# Altium schematic sheet SCD2326控制板-V0.3.SchDoc
size A1; SheetNumber: 1; SheetTotal: 1
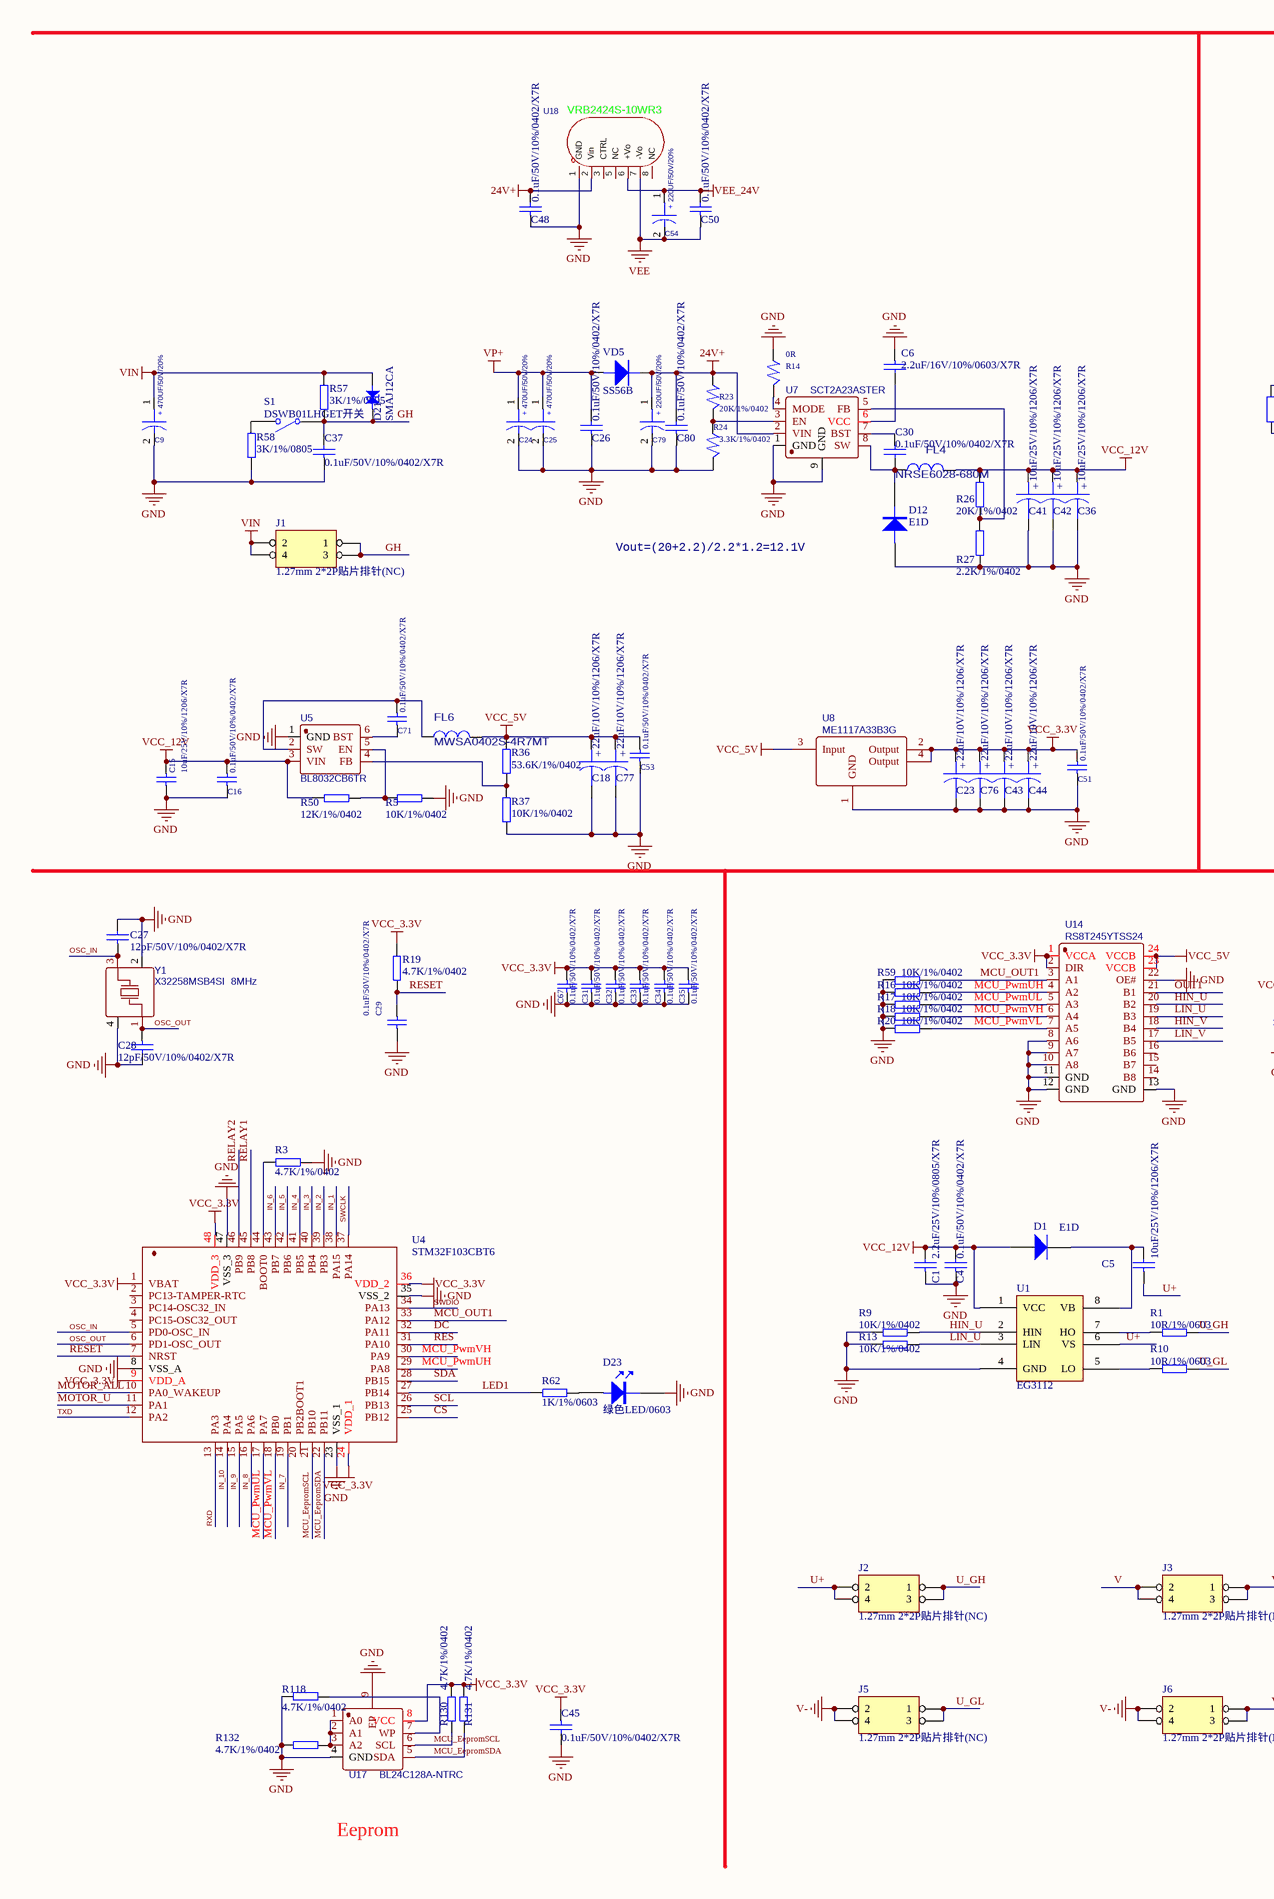
[diagram p0: SCD2326控制板-V0.3.SchDoc, left]
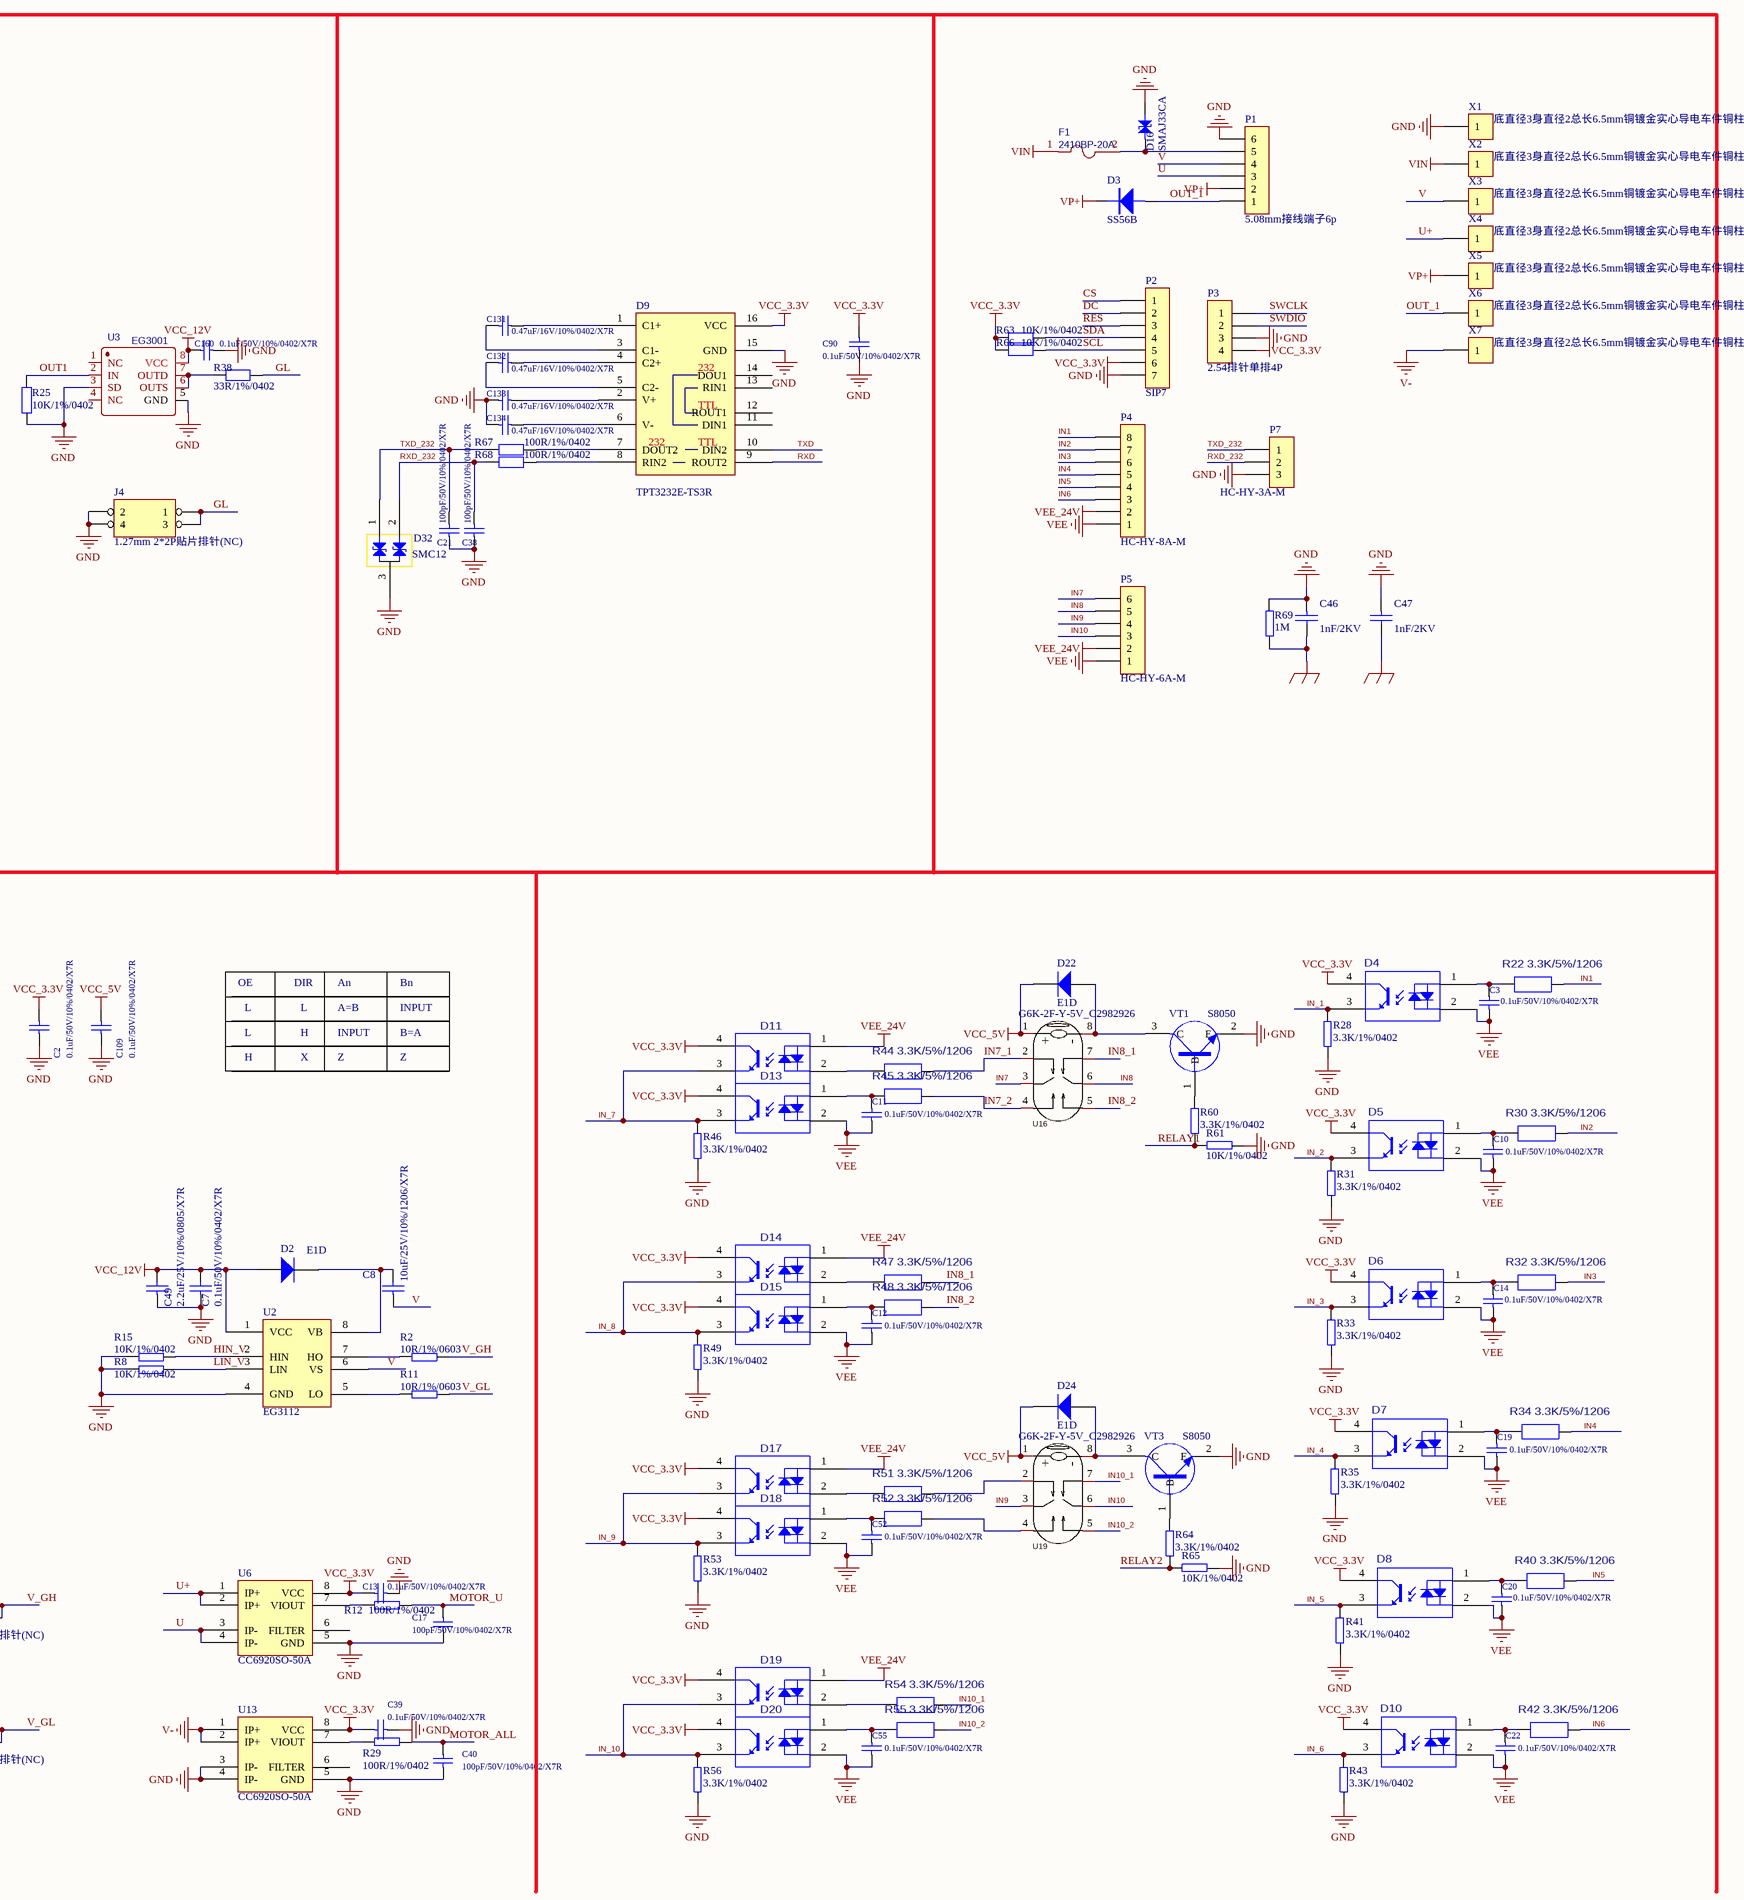
[diagram p1: SCD2326控制板-V0.3.SchDoc, right]

## Parts
C1  2.2uF/25V/10%/0805/X7R  [SC0805]
C2  0.1uF/50V/10%/0402/X7R  [SC0402]
C3  0.1uF/50V/10%/0402/X7R  [SC0402]
C4  0.1uF/50V/10%/0402/X7R  [SC0402]
C5  10uF/25V/10%/1206/X7R  [SC1206]
C6  2.2uF/16V/10%/0603/X7R  [SC0603]
C7  0.1uF/50V/10%/0402/X7R  [SC0402]
C8  10uF/25V/10%/1206/X7R  [SC1206]
C9  470UF/50V/20%  [D10]
C10  0.1uF/50V/10%/0402/X7R  [SC0402]
C11  0.1uF/50V/10%/0402/X7R  [SC0402]
C12  0.1uF/50V/10%/0402/X7R  [SC0402]
C13  0.1uF/50V/10%/0402/X7R  [SC0402]
C14  0.1uF/50V/10%/0402/X7R  [SC0402]
C15  10uF/25V/10%/1206/X7R  [SC1206]
C16  0.1uF/50V/10%/0402/X7R  [SC0402]
C17  100pF/50V/10%/0402/X7R  [SC0402]
C18  22uF/10V/10%/1206/X7R  [SC1206]
C19  0.1uF/50V/10%/0402/X7R  [SC0402]
C20  0.1uF/50V/10%/0402/X7R  [SC0402]
C21  100pF/50V/10%/0402/X7R  [SC0402]
C22  0.1uF/50V/10%/0402/X7R  [SC0402]
C23  22uF/10V/10%/1206/X7R  [SC1206]
C24  470UF/50V/20%  [D10]
C25  470UF/50V/20%  [D10]
C26  0.1uF/50V/10%/0402/X7R  [SC0402]
C27  12pF/50V/10%/0402/X7R  [SC0402]
C28  12pF/50V/10%/0402/X7R  [SC0402]
C29  0.1uF/50V/10%/0402/X7R  [SC0402]
C30  0.1uF/50V/10%/0402/X7R  [SC0402]
C31  0.1uF/50V/10%/0402/X7R  [SC0402]
C32  0.1uF/50V/10%/0402/X7R  [SC0402]
C33  0.1uF/50V/10%/0402/X7R  [SC0402]
C34  0.1uF/50V/10%/0402/X7R  [SC0402]
C35  0.1uF/50V/10%/0402/X7R  [SC0402]
C36  10uF/25V/10%/1206/X7R  [SC1206]
C37  0.1uF/50V/10%/0402/X7R  [SC0402]
C38  100pF/50V/10%/0402/X7R  [SC0402]
C39  0.1uF/50V/10%/0402/X7R  [SC0402]
C40  100pF/50V/10%/0402/X7R  [SC0402]
C41  10uF/25V/10%/1206/X7R  [SC1206]
C42  10uF/25V/10%/1206/X7R  [SC1206]
C43  22uF/10V/10%/1206/X7R  [SC1206]
C44  22uF/10V/10%/1206/X7R  [SC1206]
C45  0.1uF/50V/10%/0402/X7R  [SC0402]
C46  value 1nF/2KV  [1206_C]  (hidden comment: 1nF/2KV/10% X7R)
C47  value 1nF/2KV  [1206_C]  (hidden comment: 1nF/2KV/10% X7R)
C48  0.1uF/50V/10%/0402/X7R  [SC0402]
C49  2.2uF/25V/10%/0805/X7R  [SC0805]
C50  0.1uF/50V/10%/0402/X7R  [SC0402]
C51  0.1uF/50V/10%/0402/X7R  [SC0402]
C52  0.1uF/50V/10%/0402/X7R  [SC0402]
C53  0.1uF/50V/10%/0402/X7R  [SC0402]
C54  220UF/50V/20%  [D8]
C55  0.1uF/50V/10%/0402/X7R  [SC0402]
C67  0.1uF/50V/10%/0402/X7R  [SC0402]
C71  0.1uF/50V/10%/0402/X7R  [SC0402]
C76  22uF/10V/10%/1206/X7R  [SC1206]
C77  22uF/10V/10%/1206/X7R  [SC1206]
C79  220UF/50V/20%  [D8]
C80  0.1uF/50V/10%/0402/X7R  [SC0402]
C90  0.1uF/50V/10%/0402/X7R  [SC0402]
C109  0.1uF/50V/10%/0402/X7R  [SC0402]
C131  0.47uF/16V/10%/0402/X7R  [SC0402]
C132  0.47uF/16V/10%/0402/X7R  [SC0402]
C133  0.47uF/16V/10%/0402/X7R  [SC0402]
C134  0.47uF/16V/10%/0402/X7R  [SC0402]
C160  0.1uF/50V/10%/0402/X7R  [SC0402]
D1  E1D  [SOD123]
D2  E1D  [SOD123]
D3  SS56B  [DO-214AA]
D4  EL3H4(A)(TA)-G  [SOP-4]  (value not drawn)
D5  EL3H4(A)(TA)-G  [SOP-4]  (value not drawn)
D6  EL3H4(A)(TA)-G  [SOP-4]  (value not drawn)
D7  EL3H4(A)(TA)-G  [SOP-4]  (value not drawn)
D8  EL3H4(A)(TA)-G  [SOP-4]  (value not drawn)
D9  TPT3232E-TS3R  [TSSOP16]
D10  EL3H4(A)(TA)-G  [SOP-4]  (value not drawn)
D11  EL3H4(A)(TA)-G  [SOP-4]  (value not drawn)
D12  E1D  [SOD123]
D13  EL3H4(A)(TA)-G  [SOP-4]  (value not drawn)
D14  EL3H4(A)(TA)-G  [SOP-4]  (value not drawn)
D15  EL3H4(A)(TA)-G  [SOP-4]  (value not drawn)
D16  SMAJ33CA  [DO-214AC]
D17  EL3H4(A)(TA)-G  [SOP-4]  (value not drawn)
D18  EL3H4(A)(TA)-G  [SOP-4]  (value not drawn)
D19  EL3H4(A)(TA)-G  [SOP-4]  (value not drawn)
D20  EL3H4(A)(TA)-G  [SOP-4]  (value not drawn)
D21  SMAJ12CA  [DO-214AC]
D22  E1D  [SOD123]
D23  绿色LED/0603  [LED0603]
D24  E1D  [SOD123]
D32  SMC12  [SOT-23]
F1  2410BP-20A  [SMD2410]
FL4  NRSE6028-680M  [SMD6*6]
FL6  MWSA0402S-4R7MT  [SMD4*4]
J1  1.27mm 2*2P贴片排针(NC)  [CON_1D27_2X2]
J2  1.27mm 2*2P贴片排针(NC)  [CON_1D27_2X2]
J3  1.27mm 2*2P贴片排针(NC)  [CON_1D27_2X2]
J4  1.27mm 2*2P贴片排针(NC)  [CON_1D27_2X2]
J5  1.27mm 2*2P贴片排针(NC)  [CON_1D27_2X2]
J6  1.27mm 2*2P贴片排针(NC)  [CON_1D27_2X2]
P1  5.08mm接线端子6p  [CON_5.08_6P]
P2  SIP7  [SIP7]
P3  2.54排针单排4P  [SIP4]
P4  HC-HY-8A-M  [HC-HY-8A-M]
P5  HC-HY-6A-M  [HC-HY-6A-M]
P7  HC-HY-3A-M  [HC-HY-3A-M]
R1  10R/1%/0603  [SR0603]
R2  10R/1%/0603  [SR0603]
R3  4.7K/1%/0402  [SR0402]
R5  10K/1%/0402  [SR0402]
R8  10K/1%/0402  [SR0402]
R9  10K/1%/0402  [SR0402]
R10  10R/1%/0603  [SR0603]
R11  10R/1%/0603  [SR0603]
R12  100R/1%/0402  [SR0402]
R13  10K/1%/0402  [SR0402]
R14  0R  [SR0402]
R15  10K/1%/0402  [SR0402]
R16  10K/1%/0402  [SR0402]
R17  10K/1%/0402  [SR0402]
R18  10K/1%/0402  [SR0402]
R19  4.7K/1%/0402  [SR0402]
R20  10K/1%/0402  [SR0402]
R22  3.3K/5%/1206  [SR1206]
R23  20K/1%/0402  [SR0402]
R24  3.3K/1%/0402  [SR0402]
R25  10K/1%/0402  [SR0402]
R26  20K/1%/0402  [SR0402]
R27  2.2K/1%/0402  [SR0402]
R28  3.3K/1%/0402  [SR0402]
R29  100R/1%/0402  [SR0402]
R30  3.3K/5%/1206  [SR1206]
R31  3.3K/1%/0402  [SR0402]
R32  3.3K/5%/1206  [SR1206]
R33  3.3K/1%/0402  [SR0402]
R34  3.3K/5%/1206  [SR1206]
R35  3.3K/1%/0402  [SR0402]
R36  53.6K/1%/0402  [SR0402]
R37  10K/1%/0402  [SR0402]
R38  33R/1%/0402  [SR0402]
R40  3.3K/5%/1206  [SR1206]
R41  3.3K/1%/0402  [SR0402]
R42  3.3K/5%/1206  [SR1206]
R43  3.3K/1%/0402  [SR0402]
R44  3.3K/5%/1206  [SR1206]
R45  3.3K/5%/1206  [SR1206]
R46  3.3K/1%/0402  [SR0402]
R47  3.3K/5%/1206  [SR1206]
R48  3.3K/5%/1206  [SR1206]
R49  3.3K/1%/0402  [SR0402]
R50  12K/1%/0402  [SR0402]
R51  3.3K/5%/1206  [SR1206]
R52  3.3K/5%/1206  [SR1206]
R53  3.3K/1%/0402  [SR0402]
R54  3.3K/5%/1206  [SR1206]
R55  3.3K/5%/1206  [SR1206]
R56  3.3K/1%/0402  [SR0402]
R57  3K/1%/0805  [SR0805]
R58  3K/1%/0805  [SR0805]
R59  10K/1%/0402  [SR0402]
R60  3.3K/1%/0402  [SR0402]
R61  10K/1%/0402  [SR0402]
R62  1K/1%/0603  [SR0603]
R63  10K/1%/0402  [SR0402]
R64  3.3K/1%/0402  [SR0402]
R65  10K/1%/0402  [SR0402]
R66  10K/1%/0402  [SR0402]
R67  100R/1%/0402  [SR0402]
R68  100R/1%/0402  [SR0402]
R69  value 1M  [2010_R]  (hidden comment: 1M 1% 2KV 2010)
R118  4.7K/1%/0402  [SR0402]
R130  4.7K/1%/0402  [SR0402]
R131  4.7K/1%/0402  [SR0402]
R132  4.7K/1%/0402  [SR0402]
S1  DSWB01LHGET开关  [插件]
U1  EG3112  [SO-8]
U2  EG3112  [SO-8]
U3  EG3001  [SO-8]
U4  STM32F103CBT6  [LQFP-48]
U5  BL8032CB6TR  [TSOT23-6L]
U6  CC6920SO-50A  [SO-8]
U7  SCT2A23ASTER  [SOIC_8_EP]
U8  ME1117A33B3G  [SOT-223]
U13  CC6920SO-50A  [SO-8]
U14  RS8T245YTSS24  [TSSOP-24]
U16  G6K-2F-Y-5V_C2982926  [SMD-8_L10.0-W6.5]
U17  BL24C128A-NTRC  [UDFN-8]
U18  VRB2424S-10WR3  [VRBXXXXS-10WR3]
U19  G6K-2F-Y-5V_C2982926  [SMD-8_L10.0-W6.5]
VD5  SS56B  [SMB]
VT1  S8050  [SOT-23]
VT3  S8050  [SOT-23]
X1  底直径3身直径2总长6.5mm铜镀金实心导电车件铜柱  [CON_3D0_1TP]
X2  底直径3身直径2总长6.5mm铜镀金实心导电车件铜柱  [CON_3D0_1TP]
X3  底直径3身直径2总长6.5mm铜镀金实心导电车件铜柱  [CON_3D0_1TP]
X4  底直径3身直径2总长6.5mm铜镀金实心导电车件铜柱  [CON_3D0_1TP]
X5  底直径3身直径2总长6.5mm铜镀金实心导电车件铜柱  [CON_3D0_1TP]
X6  底直径3身直径2总长6.5mm铜镀金实心导电车件铜柱  [CON_3D0_1TP]
X7  底直径3身直径2总长6.5mm铜镀金实心导电车件铜柱  [CON_3D0_1TP]
Y1  X32258MSB4SI  8MHz  [SMD3225-4P]

## Nets
24V+: C48.2 C79.1 C80.2 R23.1 U7.2(VIN) U18.2(Vin) VD5.2(K)
GND: C1.1 C2.2 C4.1 C6.1 C7.1 C9.2 C13.1 C15.2 C16.1 C17.2 C18.2 C21.2 C23.2 C24.2 C25.2 C26.1 C27.2 C28.2 C29.2 C31.2 C32.2 C33.2 C34.2 C35.2 C36.2 C37.1 C38.2 C39.1 C40.2 C41.2 C42.2 C43.2 C44.2 C45.2 C46.1 C47.1 C48.1 C49.1 C51.1 C53.1 C67.2 C76.2 C77.2 C79.2 C80.1 C90.2 C109.2 C133.2 C134.2 C160.1 D9.15(GND) D12.1(A) D16.1 D23.2 D32.3 J4.2 J4.4 P1.6 P2.7 P3.3 P7.3 R3.2 R5.2 R8.1 R9.1 R13.1 R14.1 R15.1 R16.1 R17.1 R18.1 R20.1 R24.2 R25.2 R27.1 R28.1 R31.1 R33.1 R35.1 R37.2 R41.1 R43.1 R46.1 R49.1 R53.1 R56.1 R58.2 R59.1 R61.1 R65.1 R69.1 R118.2 R132.2 U1.4(GND) U2.4(GND) U3.3(SD) U3.5(GND) U4.8(VSS_A) U4.23(VSS_1) U4.35(VSS_2) U4.47(VSS_3) U5.1(GND) U6.5(GND) U7.1(GND) U7.9(GND) U8.1(GND) U13.3(IP-) U13.4(IP-) U13.5(GND) U14.8(A6) U14.9(A7) U14.10(A8) U14.11(GND) U14.12(GND) U14.13(GND) U14.22(OE#) U17.4(GND) U17.9(EP) U18.1(GND) VT1.2(E) VT3.2(E) X1.1 Y1.2(GND/Lid) Y1.4(GND/Lid)
PE1: C46.2 R69.2
PE2: C47.2
V-: J5.2 J5.4 J6.2 J6.4 U13.1(IP+) U13.2(IP+) X7.1
VCC_3.3V: C2.1 C13.2 C23.1 C31.1 C32.1 C33.1 C34.1 C35.1 C39.2 C43.1 C44.1 C45.1 C51.2 C67.1 C76.1 C90.1 D4.4 D5.4 D6.4 D7.4 D8.4 D9.16(VCC) D10.4 D11.4 D13.4 D14.4 D15.4 D17.4 D18.4 D19.4 D20.4 P2.6 P3.4 R19.2 R63.2 R66.2 R130.2 R131.2 U4.1(VBAT) U4.9(VDD_A) U4.24(VDD_1) U4.36(VDD_2) U4.48(VDD_3) U6.8(VCC) U8.2(Output) U8.4(Output) U13.8(VCC) U14.1(VCCA) U14.2(DIR) U17.8(VCC)
VCC_5V: C18.1 C53.2 C77.1 C109.1 D22.2(A) D24.2(A) FL6.2 R36.1 U8.3(Input) U14.23(VCCB) U14.24(VCCB) U16.1 U19.1
VCC_12V: C1.2 C4.2 C7.2 C15.1 C16.2 C36.1 C41.1 C42.1 C49.2 C160.2 D1.1(K) D2.1(K) FL4.2 R26.2 R50.1 U1.1(VCC) U2.1(VCC) U3.8(VCC) U5.3(VIN)
VEE: C3.1 C10.1 C11.1 C12.1 C14.1 C19.1 C20.1 C22.1 C50.1 C52.1 C54.2 C55.1 D4.2 D5.2 D6.2 D7.2 D8.2 D10.2 D13.2 D15.2 D18.2 D20.2 P4.1 P5.1 U18.7(-Vo)
VEE_24V: C50.2 C54.1 D11.1 D14.1 D17.1 D19.1 P4.2 P5.2 U18.6(+Vo)
VIN: C9.1 D21.1 F1.1 J1.2 J1.4 R57.2 X2.1
VP+: C24.1 C25.1 C26.2 D3.2(K) P1.2 VD5.1(A) X5.1
CS: P2.1 U4.25(PB12)
DC: P2.2 U4.32(PA11)
GH: C37.2 D21.2 J1.1 J1.3 R57.1 S1.1(COMMON)
GL: J4.1 J4.3 R38.1
HIN_U: R9.2 U1.2(HIN) U14.20(B2)
HIN_V: R15.2 U2.2(HIN) U14.18(B4)
IN1: P4.8 R22.2
IN2: P4.7 R30.2
IN3: P4.6 R32.2
IN4: P4.5 R34.2
IN5: P4.4 R40.2
IN6: P4.3 R42.2
IN7: P5.6 U16.3
IN7_1: R44.2 U16.2
IN7_2: R45.2 U16.4
IN8: P5.5 U16.6
IN8_1: R47.2 U16.7
IN8_2: R48.2 U16.5
IN9: P5.4 U19.3
IN10: P5.3 U19.6
IN10_1: R54.2 U19.7
IN10_2: R55.2 U19.5
IN_1: D4.3 R28.2 U4.38(PA15)
IN_2: D5.3 R31.2 U4.39(PB3)
IN_3: D6.3 R33.2 U4.40(PB4)
IN_4: D7.3 R35.2 U4.41(PB5)
IN_5: D8.3 R41.2 U4.42(PB6)
IN_6: D10.3 R43.2 U4.43(PB7)
IN_7: D11.3 D13.3 R46.2 U4.19(PB1)
IN_8: D14.3 D15.3 R49.2 U4.16(PA6)
IN_9: D17.3 D18.3 R53.2 U4.15(PA5)
IN_10: D19.3 D20.3 R56.2 U4.14(PA4)
LED1: R62.2 U4.27(PB14)
LIN_U: R13.2 U1.3(LIN) U14.19(B3)
LIN_V: R8.2 U2.3(LIN) U14.17(B5)
MCU_EepromSCL: R130.1 U4.21(PB10) U17.6(SCL)
MCU_EepromSDA: R131.1 U4.22(PB11) U17.5(SDA)
MCU_OUT1: R59.2 U4.33(PA12) U14.3(A1)
MCU_PwmUH: R16.2 U4.29(PA8) U14.4(A2)
MCU_PwmUL: R17.2 U4.17(PA7) U14.5(A3)
MCU_PwmVH: R18.2 U4.30(PA9) U14.6(A4)
MCU_PwmVL: R20.2 U4.18(PB0) U14.7(A5)
MOTOR_ALL: C40.1 R29.1 U4.10(PA0_WAKEUP)
MOTOR_U: C17.1 R12.1 U4.11(PA1)
OSC_IN: C27.1 U4.5(PD0-OSC_IN) Y1.3(OSC2)
OSC_OUT: C28.1 U4.6(PD1-OSC_OUT) Y1.1(OSC1)
OUT1: R25.1 U3.2(IN) U14.21(B1)
OUT_1: D3.1(A) P1.1 X6.1
RELAY1: R60.1 R61.2 U4.45(PB8)
RELAY2: R64.1 R65.2 U4.46(PB9)
RES: P2.3 U4.31(PA10)
RESET: C29.1 R19.1 U4.7(NRST)
RXD: D9.9(ROUT2) U4.13(PA3)
RXD_232: C38.1 D32.2 P7.2 R68.2
SCL: P2.5 R66.1 U4.26(PB13)
SDA: P2.4 R63.1 U4.28(PB15)
SWCLK: P3.1 U4.37(PA14)
SWDIO: P3.2 U4.34(PA13)
TXD: D9.10(DIN2) U4.12(PA2)
TXD_232: C21.1 D32.1 P7.1 R67.2
U: P1.3 U6.3(IP-) U6.4(IP-)
U+: C5.1 J2.2 J2.4 U1.6(VS) U6.1(IP+) U6.2(IP+) X4.1
U_GH: J2.1 J2.3 R1.2
U_GL: J5.1 J5.3 R10.2
V: C8.1 J3.2 J3.4 P1.4 U2.6(VS) X3.1
V_GH: J3.1 J3.3 R2.2
V_GL: J6.1 J6.3 R11.2
NetC3_2: C3.2 D4.1 R22.1
NetC5_2: C5.2 D1.2(A) U1.8(VB)
NetC6_2: C6.2 U7.6(VCC)
NetC8_2: C8.2 D2.2(A) U2.8(VB)
NetC10_2: C10.2 D5.1 R30.1
NetC11_2: C11.2 D13.1 R45.1
NetC12_2: C12.2 D15.1 R48.1
NetC14_2: C14.2 D6.1 R32.1
NetC19_2: C19.2 D7.1 R34.1
NetC20_2: C20.2 D8.1 R40.1
NetC22_2: C22.2 D10.1 R42.1
NetC30_1: C30.1 U7.7(BST)
NetC30_2: C30.2 D12.2(K) FL4.1 U7.8(SW)
NetC52_2: C52.2 D18.1 R52.1
NetC55_2: C55.2 D20.1 R55.1
NetC71_1: C71.1 U5.6(BST)
NetC71_2: C71.2 FL6.1 U5.2(SW)
NetC131_1: C131.1 D9.1(C1+)
NetC131_2: C131.2 D9.3(C1-)
NetC132_1: C132.1 D9.4(C2+)
NetC132_2: C132.2 D9.5(C2-)
NetC133_1: C133.1 D9.2(V+)
NetC134_1: C134.1 D9.6(V-)
NetD9_7: D9.7(DOUT2) R67.1
NetD9_8: D9.8(RIN2) R68.1
NetD11_2: D11.2 R44.1
NetD14_2: D14.2 R47.1
NetD16_2: D16.2 F1.2 P1.5
NetD17_2: D17.2 R51.1
NetD19_2: D19.2 R54.1
NetD22_1: D22.1(K) U16.8 VT1.3(C)
NetD23_1: D23.1 R62.1
NetD24_1: D24.1(K) U19.8 VT3.3(C)
NetR1_1: R1.1 U1.7(HO)
NetR2_1: R2.1 U2.7(HO)
NetR3_1: R3.1 U4.44(BOOT0)
NetR5_1: R5.1 R50.2 U5.5(EN)
NetR10_1: R10.1 U1.5(LO)
NetR11_1: R11.1 U2.5(LO)
NetR12_2: R12.2 U6.7(VIOUT)
NetR14_2: R14.2 U7.4(MODE)
NetR23_2: R23.2 R24.1 U7.3(EN)
NetR26_1: R26.1 R27.2 U7.5(FB)
NetR29_2: R29.2 U13.7(VIOUT)
NetR36_2: R36.2 R37.1 U5.4(FB)
NetR38_2: R38.2 U3.6(OUTS) U3.7(OUTD)
NetR51_2: R51.2 U19.2
NetR52_2: R52.2 U19.4
NetR58_1: R58.1 S1.2(NO)
NetR60_2: R60.2 VT1.1(B)
NetR64_2: R64.2 VT3.1(B)
NetR118_1: R118.1 U17.7(WP)
NetR132_1: R132.1 U17.1(A0) U17.2(A1) U17.3(A2)

Not connected (* = marked no-connect by the designer): D9 11(DIN1) 12(ROUT1) 13(RIN1) 14(DOU1); U3 1(NC) 4(NC); U4 2(PC13-TAMPER-RTC) 3(PC14-OSC32_IN) 4(PC15-OSC32_OUT) 20(PB2BOOT1); U6 6(FILTER); U13 6(FILTER); U14 14(B8) 15(B7) 16(B6); U18 3(CTRL) 5(NC) 8(NC)

## Notes on the sheet
- Vout=(20+2.2)/2.2*1.2=12.1V
- OE
- L
- DIR
- A=B
- An
- Bn
- INPUT
- H
- X
- Z
- B=A
- Eeprom
- (in symbol C) +
- (in symbol CAP POL_0) +
- (in symbol G6K-2F-Y-5V_C2982926) +; -
- (in symbol MAX3232) 232; TTL

## Library data of the parts
C1 C5 C8 = CAP: GRT188C81E475ME13D  X5R/0603
C2 C3 C10-C17 C19-C22 C29 C31-C35 C38-C40 C51-C53 C55 C67 C71 C90 C109 C131-C134 C160 = Cap_0: Publisher: Altium Limited; PackageReference: RAD-0.3; LatestRevisionNote: Re-released for DXP Platform.; LatestRevisionDate: 17-Jul-2002; Published: 8-Jun-2000
C4 C7 C49 = CAP: X7R/0402
C6 C26 C30 C37 C45-C48 C50 C80 = CAP: Capacitor
C9 C24 C25 C54 C79 = CAP POL_0
C18 C23 C36 C41-C44 C76 C77 = C: CL31A226KAHNNNE  三星或TDK
C27 C28 = CAP: 无极性电容
D1 D2 D22 D24 = Diode: YANGJIE; Manufacturer: Micro Commercial; DK Part Number: 1N4148XTPMSTR-ND; MFG Part Number: 1N4148X-TP; Part Description: DIODE SWITCHING 75V 0.15A SOD523; Value: 1n4148; Voltage: 75V
D3 D12 VD5 = DIODE
D4-D8 D10 D11 D13-D15 D17-D20 = TLP: 光耦  TLP280[GR-TP,F,T] (TOSHIBA); SAP: 31311220001
D9 = MAX3232
D16 D21 = TVS
D23 = LED: 红色LED
D32 = TVS2
F1 = JFC2410-2150TS: BOM_Manufacturer: JDTFUSE; Contributor: LCSC; BOM_Supplier: LCSC; BOM_Manufacturer Part: JFC2410-2150TS; BOM_Supplier Part: C136393; BOM_JLCPCB Part Class: Extended Part; spicePre: F; spiceSymbolName: JFC2410-2150TS
FL4 FL6 = BLM21: 电感 SRR4828A-470M  BOURNS; SAP: 31721010001
J1-J6 = HEADER 2X2
P1 P5 = CON6: Connector
P2 = CON7: Connector
P3 = CON4: Connector
P4 = CON8: Connector
P7 = CON3: Connector
R1 R2 R8-R11 R13 R15 R57 R58 = RES2: X7R/0603
R3 R5 R12 R16-R20 R26-R29 R31 R33 R35-R37 R41 R43 R46 R49 R50 R53 R56 R59-R62 R64 R65 R118 R130-R132 = RES2
R14 R23 R24 = Res1_2: Published: 8-Jun-2000; LatestRevisionDate: 17-Jul-2002; LatestRevisionNote: Re-released for DXP Platform.; PackageReference: AXIAL-0.3; Publisher: Altium Limited
R22 R30 R32 R34 R40 R42 R44 R45 R47 R48 R51 R52 R54 R55 = RES: 贴片电阻  RC1210FR-073K3L (YAGEO); SAP: 31611410003
R25 R38 R63 R66-R68 = Res2: Resistor; Value: 900OR10M; Published: 8-Jun-2000; LatestRevisionDate: 17-Jul-2002; LatestRevisionNote: Re-released for DXP Platform.; PackageReference: AXIAL-0.4; Publisher: Altium Limited; PackageDescription: Axial Device, Thru-Hole; 2 Leads; 0.4 in Pin Spacing
R69 = RES2: X7R/0402
S1 = SW-SPST: Single-Pole, Single-Throw Switch; Published: 24-Mar-1999; LatestRevisionDate: 17-Jul-2002; LatestRevisionNote: Re-released for DXP Platform.; PackageReference: SPST-2; Publisher: Altium Limited; PackageDescription: Switch; 2 Leads
U3 = EG3001: BOM_Manufacturer: EG; BOM_Supplier: LCSC; BOM_Manufacturer Part: EG3001; BOM_Supplier Part: C81708; BOM_JLCPCB Part Class: Extended Part; spicePre: U; spiceSymbolName: EG3001
U4 = STM32F103
U5 = SCT2230CTVBR: BOM_Manufacturer: SCT(芯洲科技); Contributor: LCSC; BOM_Supplier: LCSC; BOM_Supplier Part: C2930979; BOM_Manufacturer Part: SCT2230CTVBR; spicePre: U; spiceSymbolName: SCT2230CTVBR
U6 U13 = ACS724
U7 = SCT2A23ASTER: BOM_Manufacturer: SCT(芯洲科技); Contributor: LCSC; BOM_Supplier: LCSC; BOM_Supplier Part: C2901894; BOM_Manufacturer Part: SCT2A23ASTER; BOM_JLCPCB Part Class: Extended Part; spicePre: U; spiceSymbolName: SCT2A23ASTER
U8 = TLV1117-33IDCYR: BOM_Manufacturer: TI; BOM_Paste Type: expand; BOM_Assembly Type: smtWeld; BOM_Supplier: LCSC; BOM_Manufacturer Part: TLV1117-33IDCYR; image: //image.lceda.cn/szlcsc/C37359.jpg; BOM_Supplier Part: C37359; spicePre: U; spiceSymbolName: TLV1117-33IDCYR
U14 = SN74LVC8T245PW: BOM_Manufacturer: TI(德州仪器); Contributor: LCSC; BOM_Supplier: LCSC; BOM_Supplier Part: C1523276; BOM_Manufacturer Part: SN74LVC8T245PW; link: SHOWNAME=F; BOM_JLCPCB Part Class: Extended Part; spicePre: U; spiceSymbolName: SN74LVC8T245PW
U16 U19 = G6K-2F-Y-5V_C2982926: SMD-8_L10.0-W6.5; Manufacturer: OMRON(欧姆龙); Add into BOM: yes; Name: G6K-2F-Y-5V; Symbol: G6K-2F-Y-5V_C2982926; Device: G6K-2F-Y-5V_C2982926; LCSC Part Name: G6K-2F-Y-5V; Supplier Part: C2982926; Manufacturer Part: G6K-2F-Y-5V; Supplier Footprint: SMD,6.5x10mm; JLCPCB Part Class: Extended Part; Supplier: LCSC; Convert to PCB: yes
U17 = GT24C512B-2UDLI-TR: BOM_Manufacturer: Giantec; Contributor: LCSC; BOM_Supplier: LCSC; BOM_Supplier Part: C239144; BOM_Manufacturer Part: GT24C512B-2UDLI-TR; spicePre: U; spiceSymbolName: GT24C512B-2UDLI-TR
U18 = vrb2424s-10wr3_c5369853: 10W 宽压输入，隔离稳压单路,工作温度范围：-40℃ ~+ 85℃隔离电压：1500VDC2:1 超宽输入电压范围效率最高可达 88%具备输入欠压保护、输出短路保护、过流保护机制应用领域：电力、工控、通信、物联网、汽车等; Manufacturer: YLPTEC(易川); AddInBom: yes; ModelId: f8889f84bf8c4d52ac4ff91f2e88c391; ModelName: PWRM-TH_VRBXXXXS-10WR3; ModelTransform: 866.14,374.015,0,0,0,0,0,-81.299,-137.795; Number of Outputs: 2; Voltage - Supply: 18V~36V; Conversion Efficiency: 86%; Output Voltage: 24V; Output Current(Max): 417mA; Capacitive Load(Max): 220uF; Isolation Voltage(Vrms): 1.5kV; Value: 500kHz; Ripple Noise: 75mVp-p; Symbol: VRB2424S-10WR3_C5369853; LCSC Part Name: DC/DC模块电源; SupplierPart: C5369853; ManufacturerPart: VRB2424S-10WR3; Supplier Footprint: SIP,22x9.5mm; JLCPCB Part Class: Extended Part; Datasheet: https://item.szlcsc.com/datasheet/VRB2424S-10WR3/6212895.html; Supplier: LCSC; ConvertToPcb: yes; FootprintName: PWRM-TH_VRBXXXXS-10WR3; Output Power: 10W; Features: 欠压保护；短路保护；过流保护; Operating Temperature: -40℃~+85℃; Length: 22mm; Width: 9.5mm; Height: 12mm
VT1 VT3 = NPN: NPN Transistor
X1-X7 = CON1: https://item.taobao.com/item.htm?spm=a1z09.2.0.0.28292e8dsDHJ66&id=616436650412&_u=f1hghf6m80e1
Y1 = 8MHz: BOM_Manufacturer: Harmony Elec; BOM_Manufacturer Part: X3S008000BK1H-U; nameAlias: Frequency; Contributor: LCSC; BOM_Paste Type: expand; BOM_Assembly Type: smtWeld; BOM_Supplier: LCSC; BOM_Supplier Part: C254258; spicePre: X; spiceSymbolName: X3S008000BK1H-U